# Altium project B-60-30-B.PrjPcb
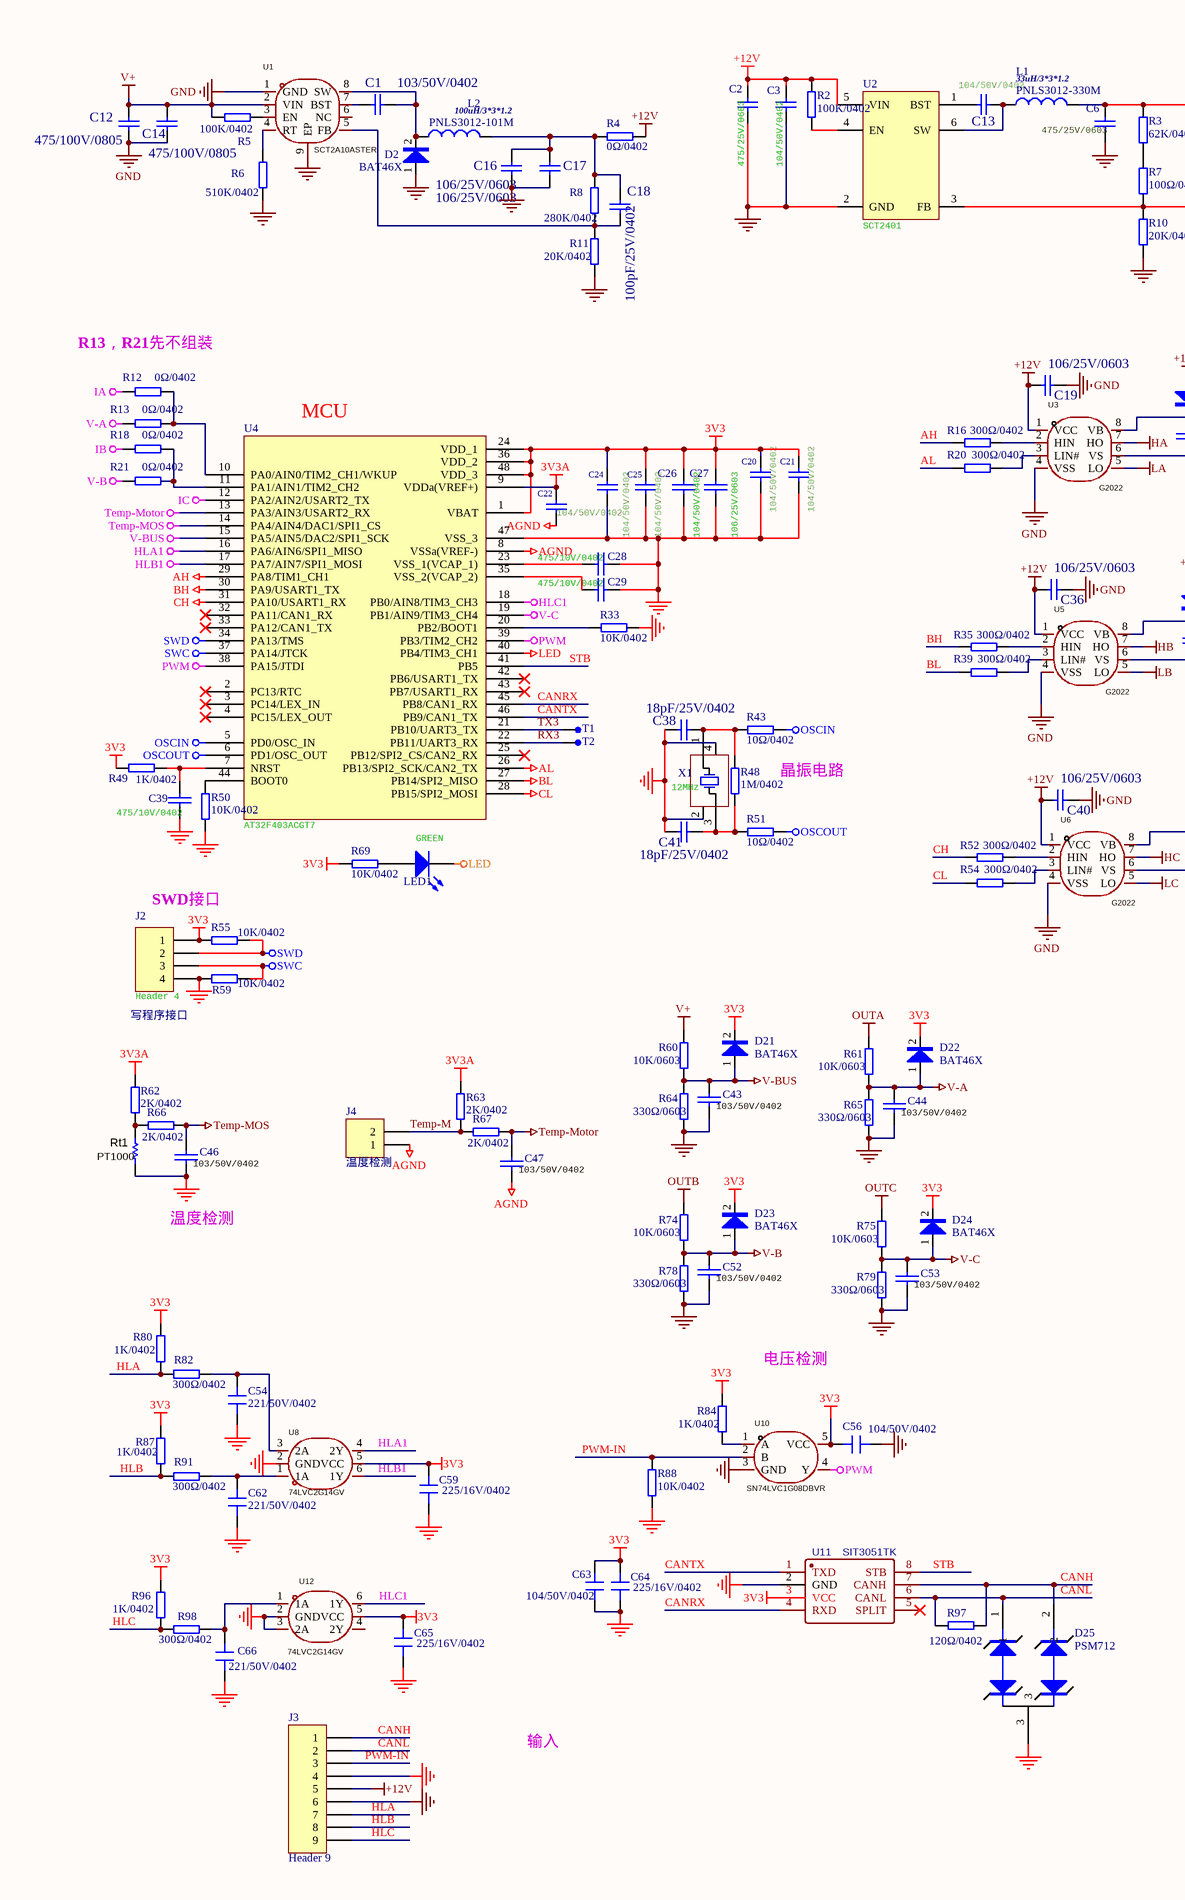
[diagram p0: B-60-30-B-20251226.SchDoc, left]
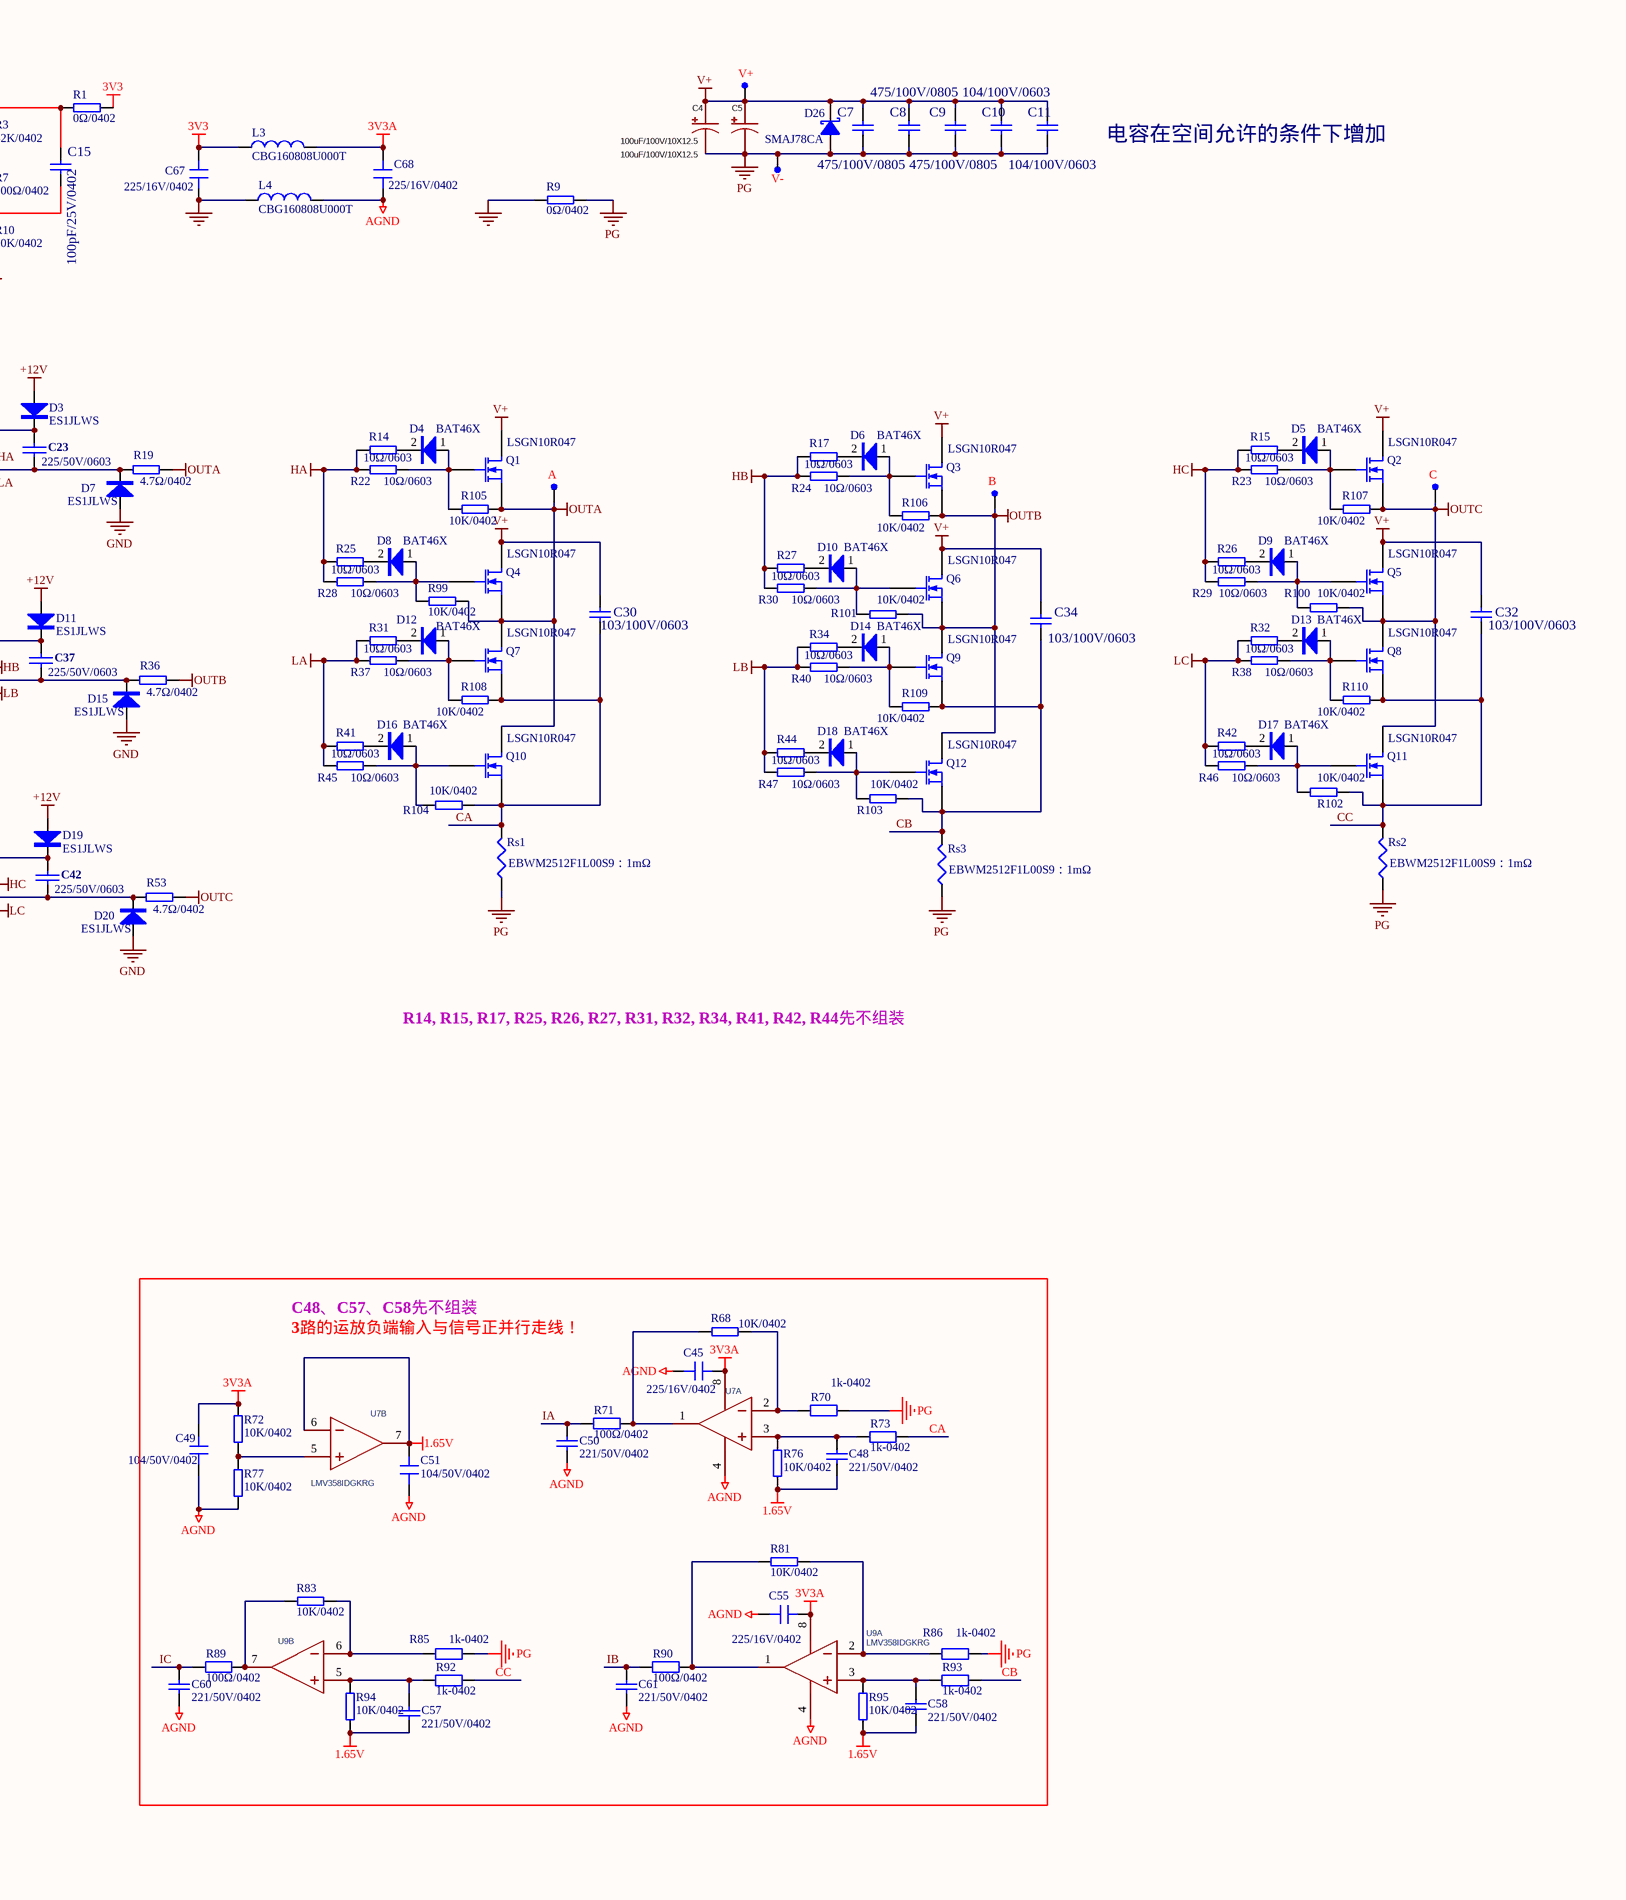
[diagram p1: B-60-30-B-20251226.SchDoc, right]
1 sheet, 241 parts. Net scope: global (net labels, ports and power ports of the same name join across sheets).
Board file: B-60-30-B.PcbDoc

## Sheet B-60-30-B-20251226.SchDoc
size A2

### Parts
A  THT_TEST_POINT  [Hole-3MM]  (value not drawn)
B  THT_TEST_POINT  [Hole-3MM]  (value not drawn)
C  THT_TEST_POINT  [Hole-3MM]  (value not drawn)
C1  103/50V/0402  [0402]
C2  475/25V/0603  [C0603]
C3  104/50V/0402  [0402]
C4  100uF/100V/10X12.5  [CAP-TH_10X20]
C5  100uF/100V/10X12.5  [CAP-TH_10X20]
C6  475/25V/0603  [C0603]
C7  475/100V/0805  [C0805]
C8  475/100V/0805  [C0805]
C9  475/100V/0805  [C0805]
C10  104/100V/0603  [C0603]
C11  104/100V/0603  [C0603]
C12  475/100V/0805  [C0805]
C13  104/50V/0402  [0402]
C14  475/100V/0805  [C0805]
C15  100pF/25V/0402  [0402]
C16  106/25V/0603  [C0603]
C17  106/25V/0603  [C0603]
C18  100pF/25V/0402  [0402]
C19  106/25V/0603  [C0603]
C20  104/50V/0402  [0402]
C21  104/50V/0402  [0402]
C22  104/50V/0402  [0402]
C23  225/50V/0603  [C0603]
C24  104/50V/0402  [0402]
C25  104/50V/0402  [0402]
C26  104/50V/0402  [0402]
C27  106/25V/0603  [C0603]
C28  475/10V/0402  [0402]
C29  475/10V/0402  [0402]
C30  103/100V/0603  [C0603]
C32  103/100V/0603  [C0603]
C34  103/100V/0603  [C0603]
C36  106/25V/0603  [C0603]
C37  225/50V/0603  [C0603]
C38  18pF/25V/0402  [0402]
C39  475/10V/0402  [0402]
C40  106/25V/0603  [C0603]
C41  18pF/25V/0402  [0402]
C42  225/50V/0603  [C0603]
C43  103/50V/0402  [0402]
C44  103/50V/0402  [0402]
C45  225/16V/0402  [0402]
C46  103/50V/0402  [0402]
C47  103/50V/0402  [0402]
C48  221/50V/0402  [0402]
C49  104/50V/0402  [0402]
C50  221/50V/0402  [0402]
C51  104/50V/0402  [0402]
C52  103/50V/0402  [0402]
C53  103/50V/0402  [0402]
C54  221/50V/0402  [0402]
C55  225/16V/0402  [0402]
C56  104/50V/0402  [0402]
C57  221/50V/0402  [0402]
C58  221/50V/0402  [0402]
C59  225/16V/0402  [0402]
C60  221/50V/0402  [0402]
C61  221/50V/0402  [0402]
C62  221/50V/0402  [0402]
C63  104/50V/0402  [0402]
C64  225/16V/0402  [0402]
C65  225/16V/0402  [0402]
C66  221/50V/0402  [0402]
C67  225/16V/0402  [0402]
C68  225/16V/0402  [0402]
D2  BAT46X  [SOD-523]
D3  ES1JLWS  [SOD-323_L1.6-W1.3-LS2.7-RD]
D4  BAT46X  [SOD-523]
D5  BAT46X  [SOD-523]
D6  BAT46X  [SOD-523]
D7  ES1JLWS  [SOD-323_L1.6-W1.3-LS2.7-RD]
D8  BAT46X  [SOD-523]
D9  BAT46X  [SOD-523]
D10  BAT46X  [SOD-523]
D11  ES1JLWS  [SOD-323_L1.6-W1.3-LS2.7-RD]
D12  BAT46X  [SOD-523]
D13  BAT46X  [SOD-523]
D14  BAT46X  [SOD-523]
D15  ES1JLWS  [SOD-323_L1.6-W1.3-LS2.7-RD]
D16  BAT46X  [SOD-523]
D17  BAT46X  [SOD-523]
D18  BAT46X  [SOD-523]
D19  ES1JLWS  [SOD-323_L1.6-W1.3-LS2.7-RD]
D20  ES1JLWS  [SOD-323_L1.6-W1.3-LS2.7-RD]
D21  BAT46X  [SOD-523]
D22  BAT46X  [SOD-523]
D23  BAT46X  [SOD-523]
D24  BAT46X  [SOD-523]
D25  PSM712  [SOT-23-3_L3.0-W1.7-P0.95-LS2.9-BR]
D26  SMAJ78CA  [SMA]
J2  Header 4  [HDR-TH_4P-P1.27-V-M]
J3  Header 9  [HDR-TH_9P-P2.00-V-M]
J4  温度检测  [SIP-2-1.27]
L1  PNLS3012-330M  value 33uH/3*3*1.2  [SMD3×3×1.3]
L2  PNLS3012-101M  value 100uH/3*3*1.2  [SMD3×3×1.3]
L3  CBG160808U000T  [L0603]
L4  CBG160808U000T  [L0603]
LED1  GREEN  [LED0603-FD]
Q1  LSGN10R047  [DFN5×6]
Q2  LSGN10R047  [DFN5×6]
Q3  LSGN10R047  [DFN5×6]
Q4  LSGN10R047  [DFN5×6]
Q5  LSGN10R047  [DFN5×6]
Q6  LSGN10R047  [DFN5×6]
Q7  LSGN10R047  [DFN5×6]
Q8  LSGN10R047  [DFN5×6]
Q9  LSGN10R047  [DFN5×6]
Q10  LSGN10R047  [DFN5×6]
Q11  LSGN10R047  [DFN5×6]
Q12  LSGN10R047  [DFN5×6]
R1  0Ω/0402  [0402]
R2  100K/0402  [0402]
R3  62K/0402  [0402]
R4  0Ω/0402  [0402]
R5  100K/0402  [0402]
R6  510K/0402  [0402]
R7  100Ω/0402  [0402]
R8  280K/0402  [0402]
R9  0Ω/0402  [0402]
R10  20K/0402  [0402]
R11  20K/0402  [0402]
R12  0Ω/0402  [0402]
R13  0Ω/0402  [0402]
R14  10Ω/0603  [R0603]
R15  10Ω/0603  [R0603]
R16  300Ω/0402  [0402]
R17  10Ω/0603  [R0603]
R18  0Ω/0402  [0402]
R19  4.7Ω/0402  [0402]
R20  300Ω/0402  [0402]
R21  0Ω/0402  [0402]
R22  10Ω/0603  [R0603]
R23  10Ω/0603  [R0603]
R24  10Ω/0603  [R0603]
R25  10Ω/0603  [R0603]
R26  10Ω/0603  [R0603]
R27  10Ω/0603  [R0603]
R28  10Ω/0603  [R0603]
R29  10Ω/0603  [R0603]
R30  10Ω/0603  [R0603]
R31  10Ω/0603  [R0603]
R32  10Ω/0603  [R0603]
R33  10K/0402  [0402]
R34  10Ω/0603  [R0603]
R35  300Ω/0402  [0402]
R36  4.7Ω/0402  [0402]
R37  10Ω/0603  [R0603]
R38  10Ω/0603  [R0603]
R39  300Ω/0402  [0402]
R40  10Ω/0603  [R0603]
R41  10Ω/0603  [R0603]
R42  10Ω/0603  [R0603]
R43  10Ω/0402  [0402]
R44  10Ω/0603  [R0603]
R45  10Ω/0603  [R0603]
R46  10Ω/0603  [R0603]
R47  10Ω/0603  [R0603]
R48  1M/0402  [0402]
R49  1K/0402  [0402]
R50  10K/0402  [0402]
R51  10Ω/0402  [0402]
R52  300Ω/0402  [0402]
R53  4.7Ω/0402  [0402]
R54  300Ω/0402  [0402]
R55  10K/0402  [0402]
R59  10K/0402  [0402]
R60  10K/0603  [0603]
R61  10K/0603  [0603]
R62  2K/0402  [0402]
R63  2K/0402  [0402]
R64  330Ω/0603  [0603]
R65  330Ω/0603  [0603]
R66  2K/0402  [0402]
R67  2K/0402  [0402]
R68  10K/0402  [0402]
R69  10K/0402  [0402]
R70  1k-0402  [0402]
R71  100Ω/0402  [0402]
R72  10K/0402  [0402]
R73  1k-0402  [0402]
R74  10K/0603  [0603]
R75  10K/0603  [0603]
R76  10K/0402  [0402]
R77  10K/0402  [0402]
R78  330Ω/0603  [0603]
R79  330Ω/0603  [0603]
R80  1K/0402  [0402]
R81  10K/0402  [0402]
R82  300Ω/0402  [0402]
R83  10K/0402  [0402]
R84  1K/0402  [0402]
R85  1k-0402  [0402]
R86  1k-0402  [0402]
R87  1K/0402  [0402]
R88  10K/0402  [0402]
R89  100Ω/0402  [0402]
R90  100Ω/0402  [0402]
R91  300Ω/0402  [0402]
R92  1k-0402  [0402]
R93  1k-0402  [0402]
R94  10K/0402  [0402]
R95  10K/0402  [0402]
R96  1K/0402  [0402]
R97  120Ω/0402  [0402]
R98  300Ω/0402  [0402]
R99  10K/0402  [0402]
R100  10K/0402  [0402]
R101  10K/0402  [0402]
R102  10K/0402  [0402]
R103  10K/0402  [0402]
R104  10K/0402  [0402]
R105  10K/0402  [0402]
R106  10K/0402  [0402]
R107  10K/0402  [0402]
R108  10K/0402  [0402]
R109  10K/0402  [0402]
R110  10K/0402  [0402]
Rs1  EBWM2512F1L00S9：1mΩ  [R2512]
Rs2  EBWM2512F1L00S9：1mΩ  [R2512]
Rs3  EBWM2512F1L00S9：1mΩ  [R2512]
Rt1  PT1000  [0402]
T1  THT_TEST_POINT  [test]  (value not drawn)
T2  THT_TEST_POINT  [test]  (value not drawn)
U1  SCT2A10ASTER  [ESOP-8]
U2  SCT2401  [TSOT-23-6_L2.9-W1.6-P0.95-LS2.8-BL]
U3  G2022  [SOP-8_L4.9-W3.9-P1.27-LS6.0-BL]
U4  AT32F403ACGT7  [LQFP-48_L7.0-W7.0-P0.50-LS9.0-BL]
U5  G2022  [SOP-8_L4.9-W3.9-P1.27-LS6.0-BL]
U6  G2022  [SOP-8_L4.9-W3.9-P1.27-LS6.0-BL]
U7  LMV358IDGKRG  [MSOP8]  (value not drawn)  (parts A,B of 2)
U8  74LVC2G14GV  [TSOT-23-6_L2.9-W1.6-P0.95-LS2.8-BL]
U9  LMV358IDGKRG  [MSOP8]  (parts A,B of 2)
U10  SN74LVC1G08DBVR  [SOT-23-5]
U11  SIT3051TK  [HVSON8]
U12  74LVC2G14GV  [TSOT-23-6_L2.9-W1.6-P0.95-LS2.8-BL]
V+  THT_TEST_POINT  [Hole-2.2MM]  (value not drawn)
V-  THT_TEST_POINT  [Hole-2.2MM]  (value not drawn)
X1  12MHz  [CRYSTAL-SMD_4P-L3.2-W2.5-BL]

### Nets
1.65V: C48.1 C51.1 C57.1 C58.1 R76.1 R94.1 R95.1 U7.6(INB-) U7.7(OUTB)
3V3: C20.2 C21.2 C24.1 C25.1 C26.1 C27.1 C56.1 C59.1 C63.1 C64.1 C65.1 C67.1 D21.2(K) D22.2(K) D23.2(K) D24.2(K) J2.1 L3.1 R1.2 R49.1 R55.2 R69.2 R80.2 R84.2 R87.1 R96.1 U4.1(VBAT) U4.24(VDD_1) U4.36(VDD_2) U4.48(VDD_3) U8.5(VCC) U10.5(VCC) U11.3(VCC) U12.5(VCC)
3V3A: C22.1 C45.1 C49.1 C55.1 C68.1 L3.2 R62.1 R63.1 R72.1 U4.9(VDDa(VREF+)) U7.8(VDD) U9.8(VDD)
+12V: C2.1 C3.1 C19.1 C36.1 C40.1 D3.1(A) D11.1(A) D19.1(A) J3.5 R2.1 R4.1 U2.5(VIN) U3.1(VCC) U5.1(VCC) U6.1(VCC)
AGND: C22.2 C45.2 C47.1 C49.2 C50.1 C51.2 C55.2 C60.1 C61.1 C68.2 J4.1 L4.2 R77.2 U4.8(VSSa(VREF-)) U7.4(VSS) U9.4(VSS)
AH: R16.2 U4.29(PA8/TIM1_CH1)
AL: R20.2 U4.26(PB13/SPI2_SCK/CAN2_TX)
BH: R35.2 U4.30(PA9/USART1_TX)
BL: R39.2 U4.27(PB14/SPI2_MISO)
CH: R52.2 U4.31(PA10/USART1_RX)
CL: R54.2 U4.28(PB15/SPI2_MOSI)
GND: C2.2 C3.2 C6.2 C12.1 C14.1 C16.2 C17.2 C19.2 C20.1 C21.1 C24.2 C25.2 C26.2 C27.2 C28.2 C29.2 C36.2 C38.1 C39.1 C40.2 C41.1 C43.1 C44.1 C46.1 C52.1 C53.1 C54.2 C56.2 C59.2 C62.2 C63.2 C64.2 C65.2 C66.2 C67.2 D2.1(A) D7.1(A) D15.1(A) D20.1(A) D25.3 J2.4 J3.4 J3.6 L4.1 R6.1 R9.1 R10.2 R11.1 R33.2 R50.2 R59.2 R64.1 R65.1 R78.1 R79.1 R88.2 Rt1.1 U1.1(GND) U1.9(EP) U2.2(GND) U3.4(VSS) U4.47(VSS_3) U5.4(VSS) U6.4(VSS) U8.2(GND) U10.3(GND) U11.2(GND) U12.2(GND) U12.3(2A) X1.2(NC) X1.4(NC)
HA: R14.1 R22.1 R25.1 R28.1 U3.7(HO)
HB: R17.1 R24.1 R27.1 R30.1 U5.7(HO)
HC: R15.1 R23.1 R26.1 R29.1 U6.7(HO)
HLA1: U4.16(PA6/AIN6/SPI1_MISO) U8.4(2Y)
HLB1: U4.17(PA7/AIN7/SPI1_MOSI) U8.6(1Y)
HLC1: U4.18(PB0/AIN8/TIM3_CH3) U12.6(1Y)
IA: C50.2 R12.2 R71.2
IB: C61.2 R18.2 R90.1
IC: C60.2 R89.2 U4.12(PA2/AIN2/USART2_TX)
LA: R31.1 R37.1 R41.1 R45.1 U3.5(LO)
LB: R34.1 R40.1 R44.1 R47.1 U5.5(LO)
LC: R32.1 R38.1 R42.1 R46.1 U6.5(LO)
LED: LED1.2 U4.40(PB4/TIM3_CH1)
OSCIN: R43.1 U4.5(PD0/OSC_IN)
OSCOUT: R51.1 U4.6(PD1/OSC_OUT)
OUTA: A.1 Q1.3(S) Q4.3(S) Q7.1(D) Q10.1(D) R19.1 R61.2 R99.2 R105.1
OUTB: B.1 Q3.3(S) Q6.3(S) Q9.1(D) Q12.1(D) R36.1 R74.2 R101.2 R106.2
OUTC: C.1 Q2.3(S) Q5.3(S) Q8.1(D) Q11.1(D) R53.1 R75.2 R100.2 R107.2
PG: C4.2 C5.2 C7.1 C8.1 C9.1 C10.2 C11.2 D26.1(A) R9.2 R70.1 R85.1 R86.1 Rs1.2(BOT) Rs2.2(BOT) Rs3.2(BOT) V-.1
PWM: U4.38(PA15/JTDI) U4.39(PB3/TIM2_CH2) U10.4(Y)
SWC: J2.3 R59.1 U4.37(PA14/JTCK)
SWD: J2.2 R55.1 U4.34(PA13/TMS)
Temp-MOS: C46.2 R66.2 U4.14(PA4/AIN4/DAC1/SPI1_CS)
Temp-Motor: C47.2 R67.2 U4.13(PA3/AIN3/USART2_RX)
V+: C4.1 C5.1 C7.2 C8.2 C9.2 C10.1 C11.1 C12.2 C14.2 C30.1 C32.1 C34.1 D26.2(K) Q1.1(D) Q2.1(D) Q3.1(D) Q4.1(D) Q5.1(D) Q6.1(D) R5.1 R60.2 U1.2(VIN) V+.1
V-A: C44.2 D22.1(A) R13.2 R61.1 R65.2
V-B: C52.2 D23.1(A) R21.2 R74.1 R78.2
V-BUS: C43.2 D21.1(A) R60.1 R64.2 U4.15(PA5/AIN5/DAC2/SPI1_SCK)
V-C: C53.2 D24.1(A) R75.1 R79.2 U4.19(PB1/AIN9/TIM3_CH4)
CA: C30.2 Q7.3(S) Q10.3(S) R73.1 R104.2 R108.2 Rs1.1(TOP)
CANH: D25.2 J3.1 R97.2 U11.7(CANH)
CANL: D25.1 J3.2 R97.1 U11.6(CANL)
CANRX: U4.45(PB8/CAN1_RX) U11.4(RXD)
CANTX: U4.46(PB9/CAN1_TX) U11.1(TXD)
CB: C34.2 Q9.3(S) Q12.3(S) R93.1 R103.2 R109.2 Rs3.1(TOP)
CC: C32.2 Q8.3(S) Q11.3(S) R92.1 R102.2 R110.2 Rs2.1(TOP)
HLA: J3.7 R80.1 R82.2
HLB: J3.8 R87.2 R91.2
HLC: J3.9 R96.2 R98.2
PWM-IN: J3.3 R88.1 U10.2(B)
RX3: T2.1 U4.22(PB11/UART3_RX)
STB: U4.41(PB5) U11.8(STB)
Temp-M: J4.2 R63.2 R67.1
TX3: T1.1 U4.21(PB10/UART3_TX)
NetC1_1: C1.1 D2.2(K) L2.1 U1.8(SW)
NetC1_2: C1.2 U1.7(BST)
NetC6_1: C6.1 C15.1 L1.2 R1.1 R3.1
NetC13_1: C13.1 L1.1 U2.6(SW)
NetC13_2: C13.2 U2.1(BST)
NetC15_2: C15.2 R7.2 R10.1 U2.3(FB)
NetC16_1: C16.1 C17.1 C18.1 L2.2 R4.2 R8.2
NetC18_2: C18.2 R8.1 R11.2 U1.5(FB)
NetC23_1: C23.1 D3.2(K) U3.8(VB)
NetC23_2: C23.2 D7.2(K) R19.2 U3.6(VS)
NetC28_1: C28.1 U4.23(VSS_1(VCAP_1))
NetC29_1: C29.1 U4.35(VSS_2(VCAP_2))
NetC37_1: C37.1 D11.2(K) U5.8(VB)
NetC37_2: C37.2 D15.2(K) R36.2 U5.6(VS)
NetC38_2: C38.2 R43.2 R48.1 X1.1
NetC39_2: C39.2 R49.2 U4.7(NRST)
NetC41_2: C41.2 R48.2 R51.2 X1.3
NetC42_1: C42.1 D19.2(K) U6.8(VB)
NetC42_2: C42.2 D20.2(K) R53.2 U6.6(VS)
NetC48_2: C48.2 R73.2 R76.2 U7.3(INA+)
NetC54_1: C54.1 R82.1 U8.3(2A)
NetC57_2: C57.2 R92.2 R94.2 U9.5(INB+)
NetC58_2: C58.2 R93.2 R95.2 U9.3(INA+)
NetC62_1: C62.1 R91.1 U8.1(1A)
NetC66_1: C66.1 R98.1 U12.1(1A)
NetD4_1: D4.1(A) Q1.2(G) R22.2 R105.2
NetD4_2: D4.2(K) R14.2
NetD5_1: D5.1(A) Q2.2(G) R23.2 R107.1
NetD5_2: D5.2(K) R15.2
NetD6_1: D6.1(A) Q3.2(G) R24.2 R106.1
NetD6_2: D6.2(K) R17.2
NetD8_1: D8.1(A) Q4.2(G) R28.2 R99.1
NetD8_2: D8.2(K) R25.2
NetD9_1: D9.1(A) Q5.2(G) R29.2 R100.1
NetD9_2: D9.2(K) R26.2
NetD10_1: D10.1(A) Q6.2(G) R30.2 R101.1
NetD10_2: D10.2(K) R27.2
NetD12_1: D12.1(A) Q7.2(G) R37.2 R108.1
NetD12_2: D12.2(K) R31.2
NetD13_1: D13.1(A) Q8.2(G) R38.2 R110.1
NetD13_2: D13.2(K) R32.2
NetD14_1: D14.1(A) Q9.2(G) R40.2 R109.1
NetD14_2: D14.2(K) R34.2
NetD16_1: D16.1(A) Q10.2(G) R45.2 R104.1
NetD16_2: D16.2(K) R41.2
NetD17_1: D17.1(A) Q11.2(G) R46.2 R102.1
NetD17_2: D17.2(K) R42.2
NetD18_1: D18.1(A) Q12.2(G) R47.2 R103.1
NetD18_2: D18.2(K) R44.2
NetLED1_1: LED1.1 R69.1
NetR2_2: R2.2 U2.4(EN)
NetR3_2: R3.2 R7.1
NetR5_2: R5.2 U1.3(EN)
NetR6_2: R6.2 U1.4(RT)
NetR12_1: R12.1 R13.1 U4.10(PA0/AIN0/TIM2_CH1/WKUP)
NetR16_1: R16.1 U3.2(HIN)
NetR18_1: R18.1 R21.1 U4.11(PA1/AIN1/TIM2_CH2)
NetR20_1: R20.1 U3.3(LIN#)
NetR33_1: R33.1 U4.20(PB2/BOOT1)
NetR35_1: R35.1 U5.2(HIN)
NetR39_1: R39.1 U5.3(LIN#)
NetR50_1: R50.1 U4.44(BOOT0)
NetR52_1: R52.1 U6.2(HIN)
NetR54_1: R54.1 U6.3(LIN#)
NetR62_2: R62.2 R66.1 Rt1.2
NetR68_1: R68.1 R70.2 U7.2(INA-)
NetR68_2: R68.2 R71.1 U7.1(OUTA)
NetR72_2: R72.2 R77.1 U7.5(INB+)
NetR81_1: R81.1 R86.2 U9.2(INA-)
NetR81_2: R81.2 R90.2 U9.1(OUTA)
NetR83_1: R83.1 R85.2 U9.6(INB-)
NetR83_2: R83.2 R89.1 U9.7(OUTB)
NetR84_1: R84.1 U10.1(A)

Not connected (* = marked no-connect by the designer): U1 6(NC); U4 2(PC13/RTC)* 3(PC14/LEX_IN)* 4(PC15/LEX_OUT)* 25(PB12/SPI2_CS/CAN2_RX)* 32(PA11/CAN1_RX)* 33(PA12/CAN1_TX)* 42(PB6/USART1_TX)* 43(PB7/USART1_RX)*; U11 5(SPLIT)*; U12 4(2Y)

### Notes on the sheet
- 电容在空间允许的条件下增加
- (near R12) R13，R21先不组装
- (near U4) MCU
- 晶振电路
- SWD接口
- R14, R15, R17, R25, R26, R27, R31, R32, R34, R41, R42, R44先不组装
- (near J2) 写程序接口
- 温度检测
- C48、C57、C58先不组装
- 3路的运放负端输入与信号正并行走线！
- 电压检测
- 输入
- Title
- Size:
- Date:
- File:
- A2
- Number:
- Time:
- Revision:
- Sheet
- of

### Library data of the parts
A B C T1 T2 V+ V- = THT_TEST_POINT: THT Test Point
C1 C13 C20-C22 C24 C25 = Cap Semi: Capacitor (Semiconductor SIM Model); Value: 104/100V/0603; Published: 8-Jun-2000; LatestRevisionDate: 29-May-2009; LatestRevisionNote: IPC-7351 Footprint Added.; PackageReference: C1206; Publisher: Altium Limited; PackageDescription: Chip Capacitor
C2 C3 C6 = Cap: Capacitor; Value: 0.1uF; Published: 8-Jun-2000; LatestRevisionDate: 17-Jul-2002; LatestRevisionNote: Re-released for DXP Platform.; Publisher: Altium Limited
C4 C5 = LKME1252A101MF: Manufacturer: Ymin(永铭); Add into BOM: yes; Value: 100uF; Tolerance: ±20%; Voltage Rating: 100V; Pin Spacing: 5mm; Lifetime: 10000hrs@105℃; Symbol: LKME1252A101MF; Device: LKME1252A101MF; LCSC Part Name: 100uF ±20% 100V; Supplier Part: C443137; Manufacturer Part: LKME1252A101MF; Supplier Footprint: 插件,D10xL12.5mm; JLCPCB Part Class: Extended Part; Supplier: LCSC; Convert to PCB: yes; Ripple Current: -; Equivalent Series Resistance(ESR): -; Diameter: 10mm; Height - Seated (Max): 12.5mm
C7-C9 C12 C14 = Cap Semi: Capacitor (Semiconductor SIM Model); Value: 475/100V/1210; Published: 8-Jun-2000; LatestRevisionDate: 29-May-2009; LatestRevisionNote: IPC-7351 Footprint Added.; PackageReference: C1206; Publisher: Altium Limited; PackageDescription: Chip Capacitor
C10 C11 C16 C17 C19 C30 C32 C34 C36 C40 = Cap Semi: Capacitor (Semiconductor SIM Model); Value: 226/25V/0805; Published: 8-Jun-2000; LatestRevisionDate: 29-May-2009; LatestRevisionNote: IPC-7351 Footprint Added.; PackageReference: C1206; Publisher: Altium Limited; PackageDescription: Chip Capacitor
C15 C18 C38 C41 = Cap Semi: Capacitor (Semiconductor SIM Model); Value: 106/25V/0603; Published: 8-Jun-2000; LatestRevisionDate: 29-May-2009; LatestRevisionNote: IPC-7351 Footprint Added.; PackageReference: C1206; Publisher: Altium Limited; PackageDescription: Chip Capacitor
C23 C26-C29 C37 C39 C42-C44 C46 C47 C52 C53 = CAP: Capacitor
C45 C49 C51 C54-C56 C59 C62-C68 = C
C48 C50 C57 C58 C60 C61 = Cap
D2-D24 = 100HF100PV: Diode
D26 = D2
J2 = Header 4: Header, 4-Pin; LatestRevisionDate: 17-Jul-2002; LatestRevisionNote: Re-released for DXP Platform.; Publisher: Altium Limited
J3 = Header 9: Header, 9-Pin; LatestRevisionDate: 17-Jul-2002; LatestRevisionNote: Re-released for DXP Platform.; Publisher: Altium Limited
J4 = Header 2: Header, 2-Pin; LatestRevisionDate: 17-Jul-2002; LatestRevisionNote: Re-released for DXP Platform.; Publisher: Altium Limited
L1 L2 = 1.0mH-TH-8*10: WE-TI Inductor,Isat=0.30A,Rdc=1.67Ω,8*10; Manufacturer: Wurth Elektronik; Part Number: 744772102; Package: TH
L3 L4 = LMLCB2B1608-000B
LED1 = LED3: Typical SiC LED; Published: 8-Jun-2000; LatestRevisionDate: 17-Dec-2003; LatestRevisionNote: PCB Footprint replaced.; Publisher: Altium Limited
Q1-Q12 = MOSFET-N: N-Channel MOSFET; Published: 8-Jun-2000; LatestRevisionDate: 17-Jul-2002; LatestRevisionNote: Re-released for DXP Platform.; PackageVersion: 1995/1996; PackageReference: E3; Publisher: Altium Limited; PackageDescription: TO, Flat Index; 3 In-Line, Axial Leads; Body Dia. 4.6mm; Lead Dia. 0.5 mm (max)
R1-R55 R59-R110 = R
Rs1-Rs3 = RES: Resistor; Value: 0.02Ω
Rt1 = Res Semi: Semiconductor Resistor; Value: 10K; Published: 8-Jun-2000; LatestRevisionDate: 17-Jul-2002; LatestRevisionNote: Re-released for DXP Platform.; PackageReference: 0603; Publisher: Altium Limited
U1 = SCT2A10ASTER: Manufacturer: SCT(芯洲科技); Add into BOM: yes; Function: 降压型; Output Type: 固定; Input Voltage: 4.5V~100V; Output Voltage: 800mV~24V; Output Current: 600mA; Switching Frequency: 300kHz~800kHz; Synchronous Rectification: 是; Number of Outputs: 1; Topology: 降压式; Quiescent Current (Iq): 100uA; Switch tube (built-in/external): 内置; Symbol: SCT2A10ASTER; Device: SCT2A10ASTER; LCSC Part Name: 4.5V-100V输入、0.6A输出、高效率同步降压DC-DC转换器; Supplier Part: C2916528; Manufacturer Part: SCT2A10ASTER; Supplier Footprint: ESOP-8; JLCPCB Part Class: Extended Part; Datasheet: https://atta.szlcsc.com/upload/public/pdf/source/20211112/E759373F9DDE31F3483D2329670A01AA.pdf; Supplier: LCSC; Convert to PCB: yes; Operating Temperature: -40℃~+125℃
U2 = LMR14006
U3 U5 U6 = G2022: Manufacturer: WXNSIC(国硅集成); Add into BOM: yes; Load Type: MOSFET；IGBT; Fall Time: 40ns; Symbol: G2022; Device: G2022; LCSC Part Name: 单相高低侧功率MOSFET/IGBT驱动芯片; Supplier Part: C41414475; Manufacturer Part: G2022; Supplier Footprint: SOP-8; JLCPCB Part Class: Extended Part; Datasheet: https://item.szlcsc.com/datasheet/G2022/43233047.html; Supplier: LCSC; Convert to PCB: yes; Operating Temperature: -40℃~+125℃
U7 U9 = LMV358IDGKRG: Manufacturer: HGC(深圳汉芯); Add into BOM: yes; Number of Circuits: 双路; Maximum Power Supply Range (Vdd-Vss): 5.5V; Rail to Rail: 轨到轨输出; Gain Bandwidth Product(GBP): 1MHz; Voltage - Input Offset(Vos): 3.5mV; Input Offset Voltage Drift (Vos TC): 2.7uV/℃; Slew Rate(SR): 0.6V/us; Noise density(eN): 20nV/√Hz@10kHz; Common Mode Rejection Ratio (CMRR): 68dB; Symbol: LMV358IDGKRG; Device: LMV358IDGKRG; LCSC Part Name: LMV358IDGKRG; Supplier Part: C5145253; Manufacturer Part: LMV358IDGKRG; Supplier Footprint: MSOP-8L; JLCPCB Part Class: Extended Part; Datasheet: https://atta.szlcsc.com/upload/public/pdf/source/20221021/F6AADBCE20DACD6F9829379C38E8D4E4.pdf; Supplier: LCSC; Convert to PCB: yes; Operating Temperature: -40℃~+125℃
U8 U12 = 74LVC2G14GV,125: Manufacturer: Nexperia(安世); Add into BOM: yes; Input Type: 施密特触发器; Supply Voltage(Single): 1.65V~5.5V; Supply Current (Max): 4uA; Number of Circuits: 2; Sink Current: 32mA; High level range (VIH): 1.5V~3.6V; Low level range (VIL): 250mV~1.2V; Max Propagation Delay: 4.3ns@5V,50pF; Symbol: 74LVC2G14GV,125; Device: 74LVC2G14GV,125; LCSC Part Name: 双路施密特触发反相器; Supplier Part: C426708; Manufacturer Part: 74LVC2G14GV,125; Supplier Footprint: TSOP-6-1.5mm; JLCPCB Part Class: Extended Part; Datasheet: https://atta.szlcsc.com/upload/public/pdf/source/20190910/C426708_2EB9B025A356EF78E3873476A80EEF6F.pdf; Supplier: LCSC; Convert to PCB: yes; Source Current: 32mA; Series: 74LVC系列
U10 = SN74LVC1G08DBVR(UMW): Manufacturer: UMW(友台半导体); Symbol: SN74LVC1G08DBVR_C434068; Add into BOM: yes; Logic Gate Type: 与门; Number of Channels: 1; Supply Voltage: 1.65V~5.5V; Quiescent Current (Max): 10uA; Sink Current: 32mA; High Level Range (VIH): 1.7V; Propagation Delay Time: 10ns@5V,15pF; Device: SN74LVC1G08DBVR(UMW); LCSC Part Name: 门极和反相器; Supplier Part: C434068; Manufacturer Part: SN74LVC1G08DBVR(UMW); Supplier Footprint: SOT-23-5; JLCPCB Part Class: Extended Part; Datasheet: https://atta.szlcsc.com/upload/public/pdf/source/20241113/984F0765BD3116AA5844B02C7C0EC901.pdf; Supplier: LCSC; Convert to PCB: yes; Source Current: 32mA; Series: 74LVC系列; Operating Temperature: -40℃~+105℃
U11 = SIT1042T: Contributor: LCSC; Supplier: LCSC; Supplier Part: C1121843; Manufacturer Part: SIT1042T; JLCPCB Part Class: Extended Part; spicePre: U; spiceSymbolName: SIT1042T
X1 = xtal